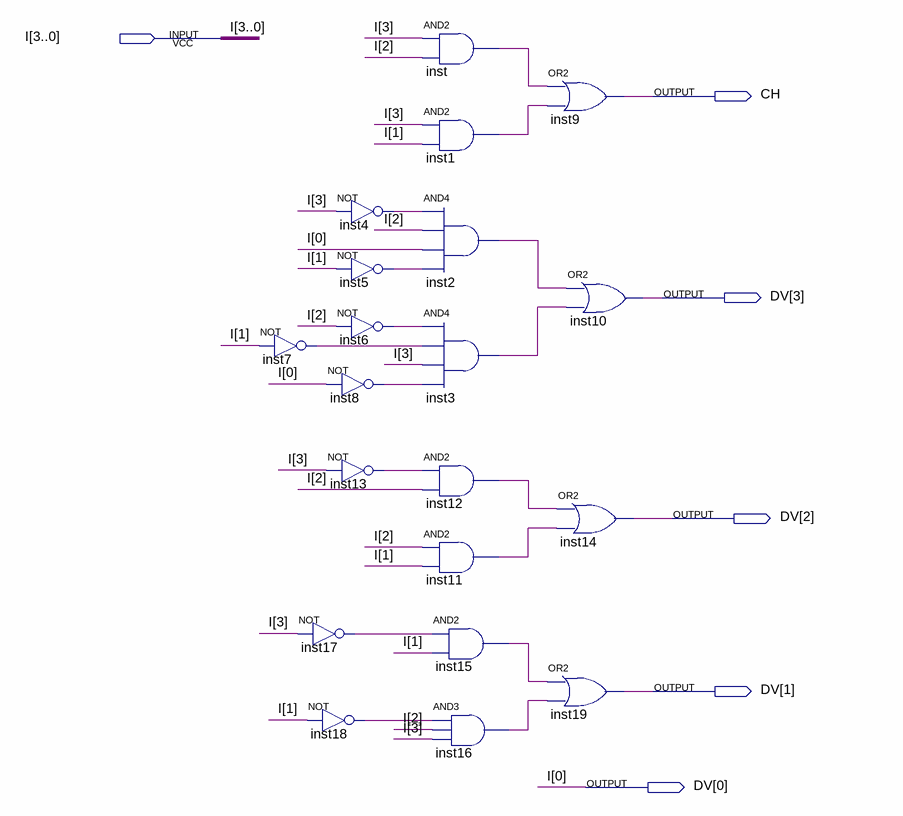
[diagram p0: schematic sheet]
// Quartus schematic bcd4.bdf as structural Verilog: 20 symbols, 6 pins
module bcd4 (
  input  [3:0] I,
  output CH,
  output [3:0] DV
);

  wire inst1_out, inst2_out, inst3_out, inst4_out, inst5_out, inst6_out, inst7_out, inst8_out, inst11_out,
       inst12_out, inst13_out, inst15_out, inst16_out, inst17_out, inst18_out, inst_out;

  not inst7 (inst7_out, I[1]);
  not inst4 (inst4_out, I[3]);
  not inst5 (inst5_out, I[1]);
  not inst6 (inst6_out, I[2]);
  not inst8 (inst8_out, I[0]);
  not inst13 (inst13_out, I[3]);
  not inst17 (inst17_out, I[3]);
  not inst18 (inst18_out, I[1]);
  and inst (inst_out, I[3], I[2]);
  and inst1 (inst1_out, I[3], I[1]);
  and inst2 (inst2_out, inst4_out, I[2], I[0], inst5_out);
  and inst3 (inst3_out, inst6_out, inst7_out, I[3], inst8_out);
  and inst12 (inst12_out, inst13_out, I[2]);
  and inst11 (inst11_out, I[2], I[1]);
  and inst15 (inst15_out, inst17_out, I[1]);
  and inst16 (inst16_out, inst18_out, I[2], I[3]);
  or inst9 (CH, inst_out, inst1_out);
  or inst10 (DV[3], inst2_out, inst3_out);
  or inst14 (DV[2], inst12_out, inst11_out);
  or inst19 (DV[1], inst15_out, inst16_out);

  assign DV[0] = I[0];
endmodule
